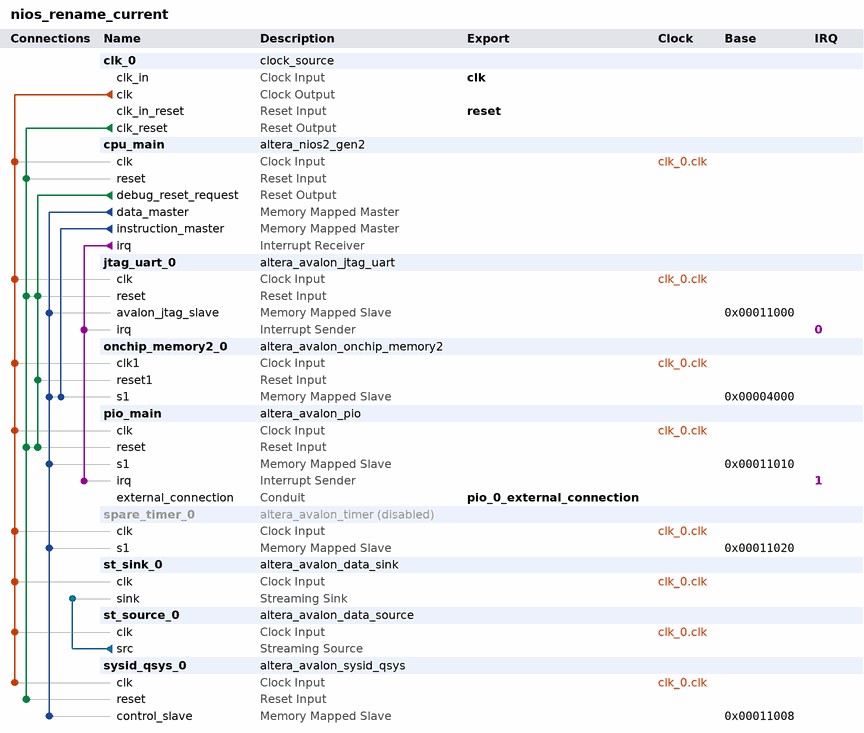
[diagram p0: system contents]
# Platform Designer (Qsys) system nios_rename_current
# Parameters at their usual value, and those the tool derives, are not listed.
package require -exact qsys 18.1
create_system nios_rename_current
set_project_property DEVICE_FAMILY {Cyclone V}

add_instance clk_0 clock_source 18.1
set_instance_parameter_value clk_0 clockFrequency 50000000

add_instance cpu_main altera_nios2_gen2 18.1
set_instance_parameter_value cpu_main resetSlave onchip_memory2_0.s1

add_instance jtag_uart_0 altera_avalon_jtag_uart 18.1

add_instance onchip_memory2_0 altera_avalon_onchip_memory2 18.1
set_instance_parameter_value onchip_memory2_0 memorySize 20480
set_instance_parameter_value onchip_memory2_0 dualPort false

add_instance pio_main altera_avalon_pio 18.1
set_instance_parameter_value pio_main direction Output
set_instance_parameter_value pio_main width 8

add_instance spare_timer_0 altera_avalon_timer 18.1
set_instance_property spare_timer_0 ENABLED false
set_instance_parameter_value spare_timer_0 period 1

add_instance st_sink_0 altera_avalon_data_sink 18.1

add_instance st_source_0 altera_avalon_data_source 18.1

add_instance sysid_qsys_0 altera_avalon_sysid_qsys 18.1
set_instance_parameter_value sysid_qsys_0 id 0

# connections
add_connection clk_0.clk cpu_main.clk clock
add_connection clk_0.clk jtag_uart_0.clk clock
add_connection clk_0.clk onchip_memory2_0.clk1 clock
add_connection clk_0.clk pio_main.clk clock
add_connection clk_0.clk spare_timer_0.clk clock
add_connection clk_0.clk st_sink_0.clk clock
add_connection clk_0.clk st_source_0.clk clock
add_connection clk_0.clk sysid_qsys_0.clk clock
add_connection clk_0.clk_reset cpu_main.reset reset
add_connection clk_0.clk_reset jtag_uart_0.reset reset
add_connection clk_0.clk_reset pio_main.reset reset
add_connection clk_0.clk_reset sysid_qsys_0.reset reset
add_connection cpu_main.debug_reset_request jtag_uart_0.reset reset
add_connection cpu_main.debug_reset_request onchip_memory2_0.reset1 reset
add_connection cpu_main.debug_reset_request pio_main.reset reset
add_connection cpu_main.data_master jtag_uart_0.avalon_jtag_slave avalon
set_connection_parameter_value cpu_main.data_master/jtag_uart_0.avalon_jtag_slave baseAddress 0x00011000
add_connection cpu_main.data_master onchip_memory2_0.s1 avalon
set_connection_parameter_value cpu_main.data_master/onchip_memory2_0.s1 baseAddress 0x00004000
add_connection cpu_main.data_master pio_main.s1 avalon
set_connection_parameter_value cpu_main.data_master/pio_main.s1 baseAddress 0x00011010
add_connection cpu_main.data_master spare_timer_0.s1 avalon
set_connection_parameter_value cpu_main.data_master/spare_timer_0.s1 baseAddress 0x00011020
add_connection cpu_main.data_master sysid_qsys_0.control_slave avalon
set_connection_parameter_value cpu_main.data_master/sysid_qsys_0.control_slave baseAddress 0x00011008
add_connection cpu_main.instruction_master onchip_memory2_0.s1 avalon
set_connection_parameter_value cpu_main.instruction_master/onchip_memory2_0.s1 baseAddress 0x00004000
add_connection st_source_0.src st_sink_0.sink avalon_streaming
add_connection cpu_main.irq jtag_uart_0.irq interrupt
set_connection_parameter_value cpu_main.irq/jtag_uart_0.irq irqNumber 0
add_connection cpu_main.irq pio_main.irq interrupt
set_connection_parameter_value cpu_main.irq/pio_main.irq irqNumber 1

# exported interfaces
add_interface clk clock sink
set_interface_property clk EXPORT_OF clk_0.clk_in
add_interface reset reset sink
set_interface_property reset EXPORT_OF clk_0.clk_in_reset
add_interface pio_0_external_connection conduit end
set_interface_property pio_0_external_connection EXPORT_OF pio_main.external_connection

set_interconnect_requirement {$system} qsys_mm.clockCrossingAdapter HANDSHAKE

save_system nios_rename_current.qsys
